# Altium schematic sheet RF_circuit.SchDoc
size A1; SheetNumber: 4; SheetTotal: 6
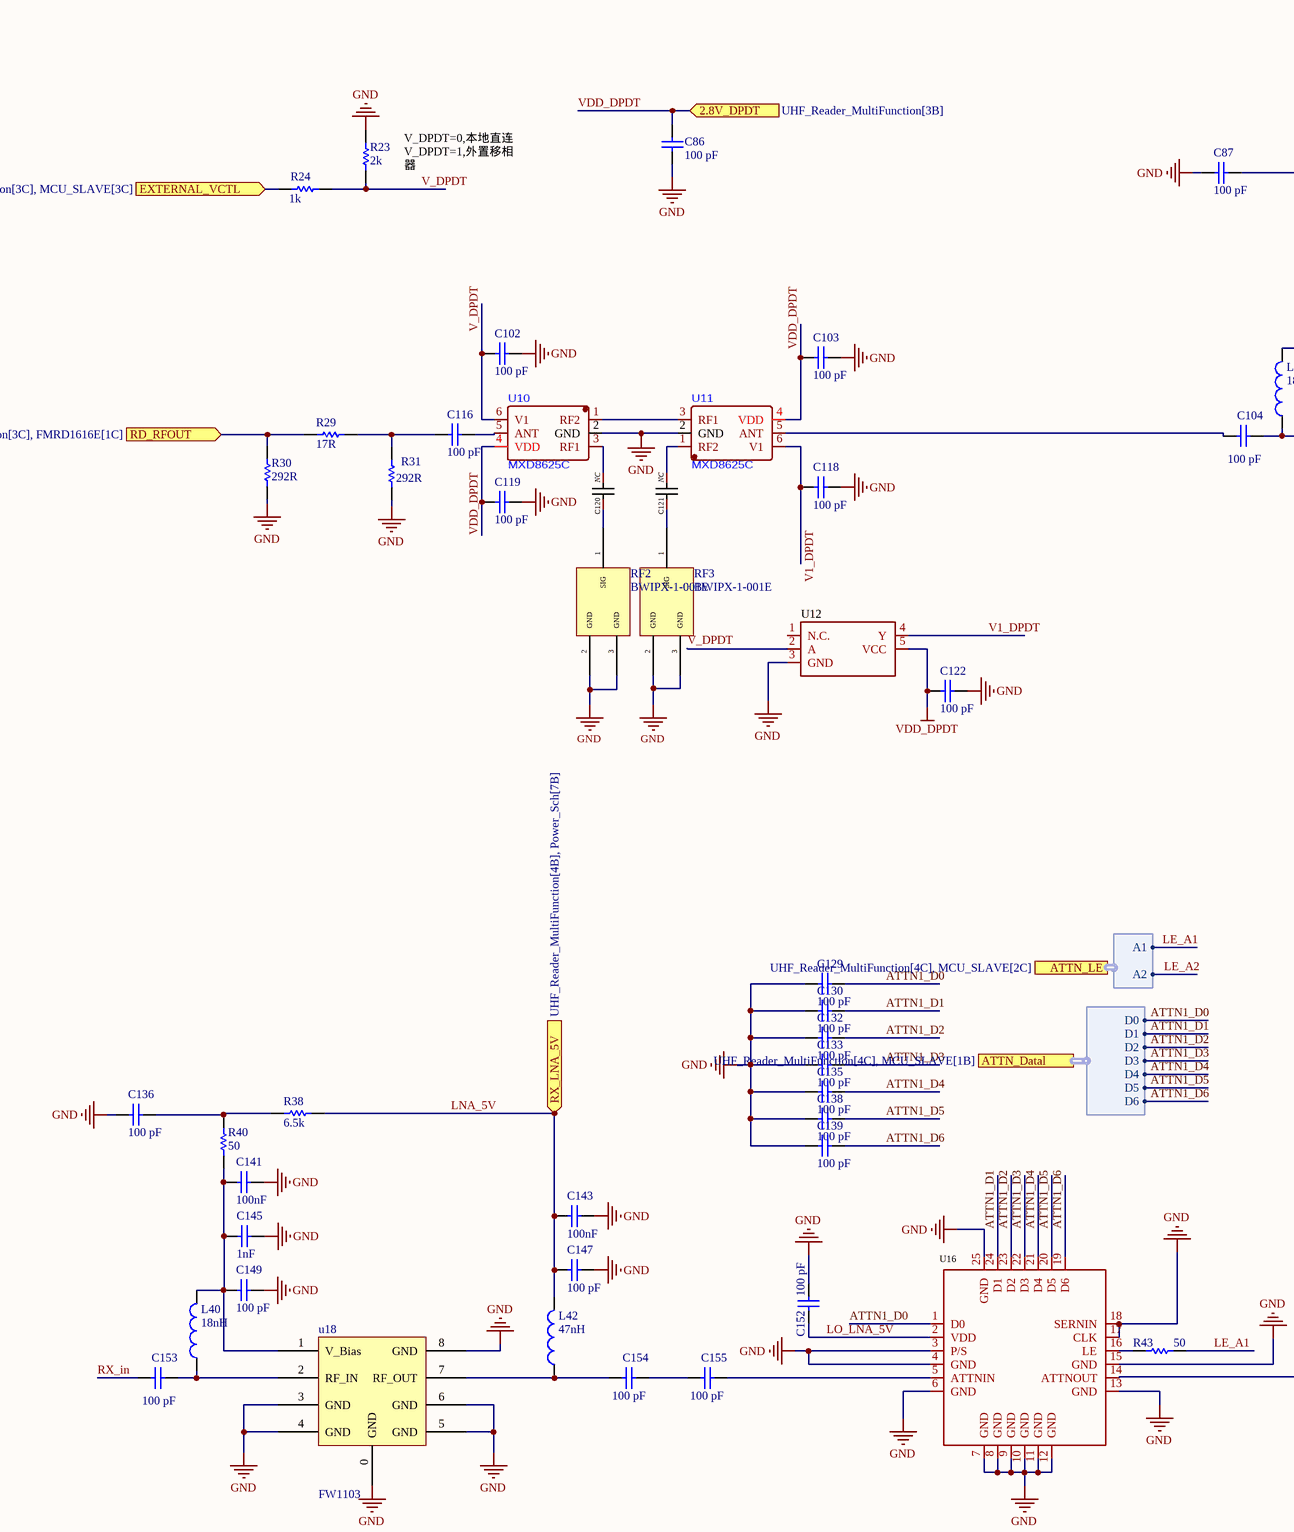
[diagram p0: RF_circuit.SchDoc, top left]
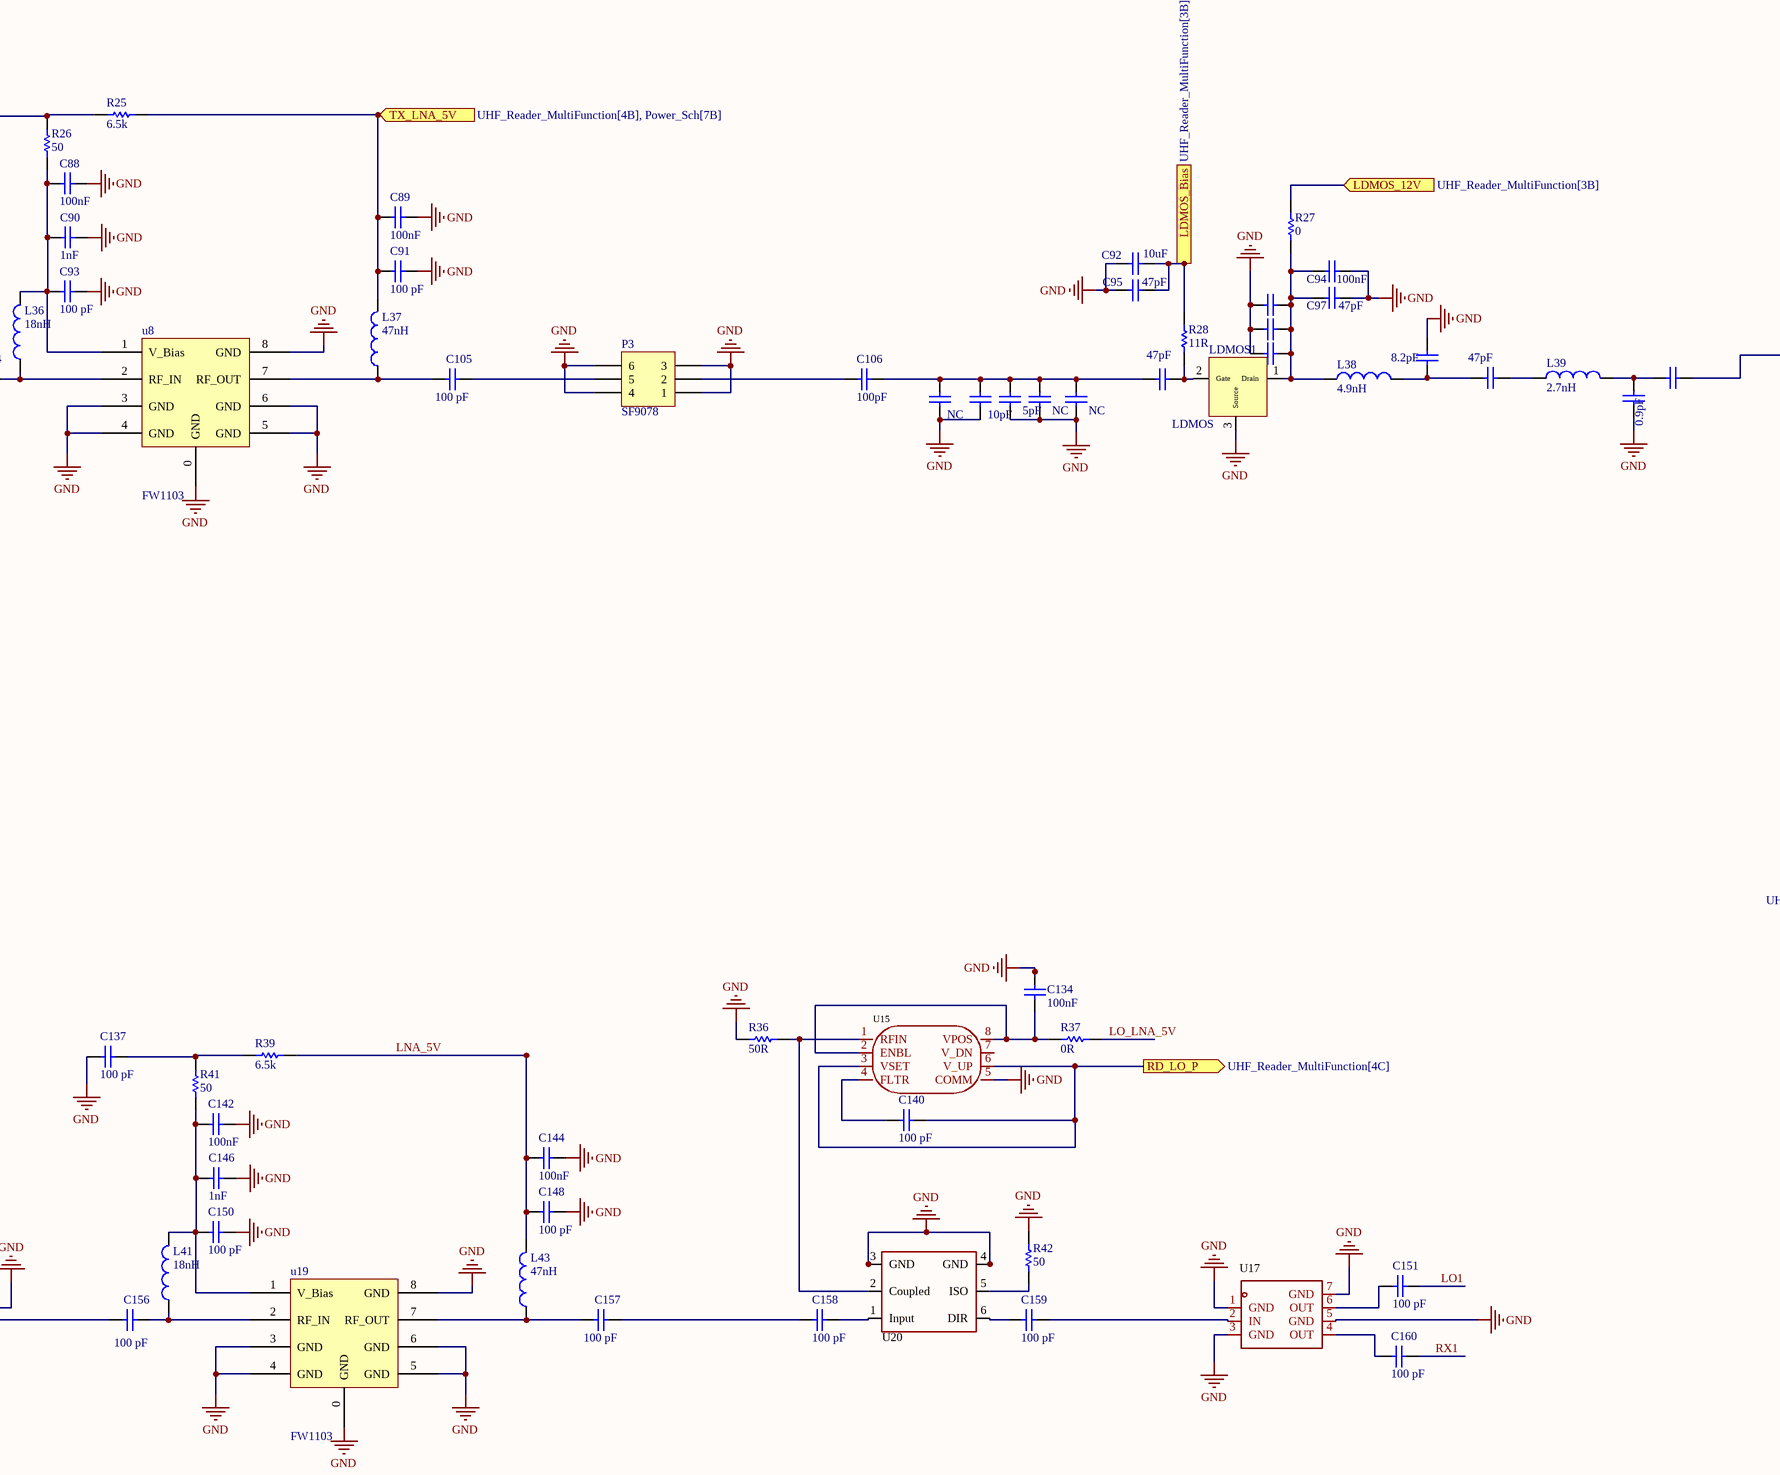
[diagram p1: RF_circuit.SchDoc, top middle]
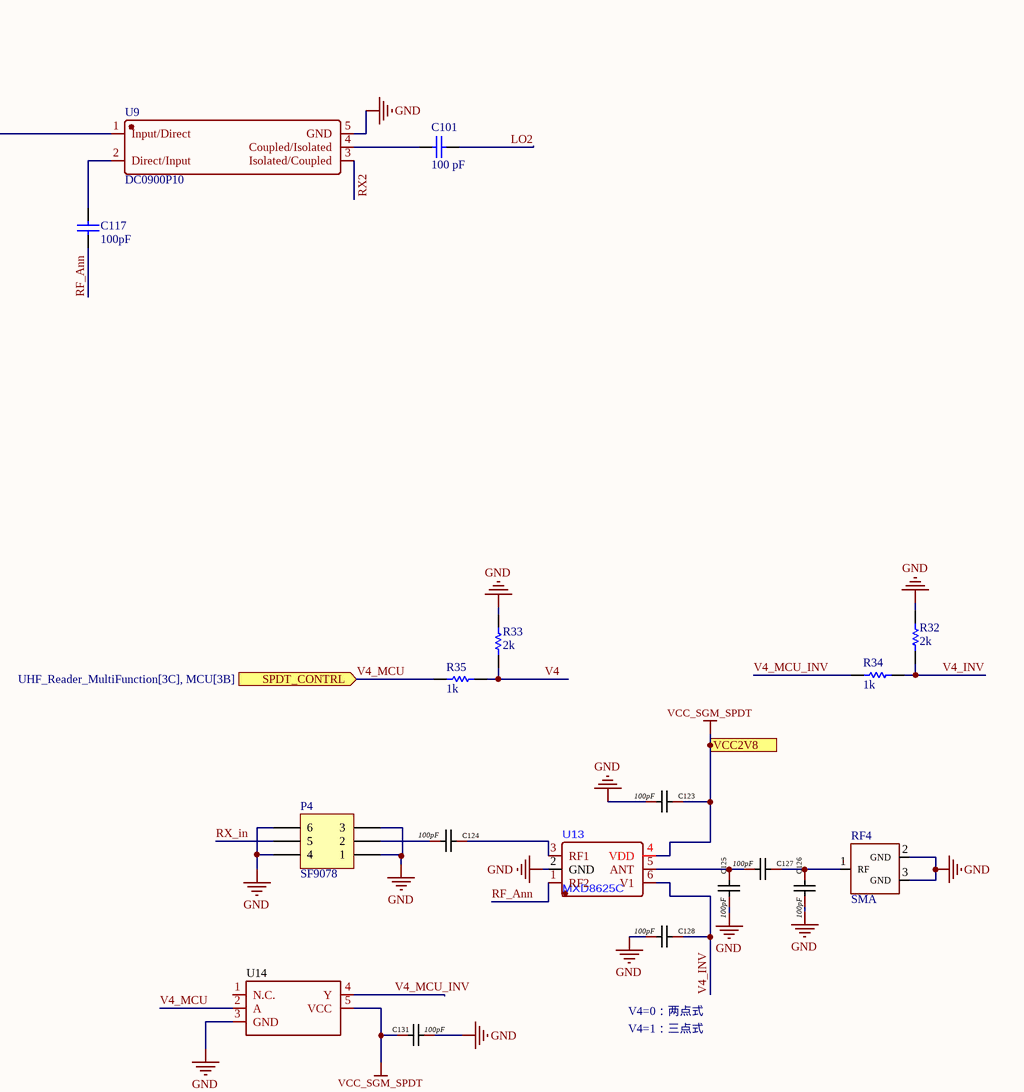
[diagram p2: RF_circuit.SchDoc, top right]
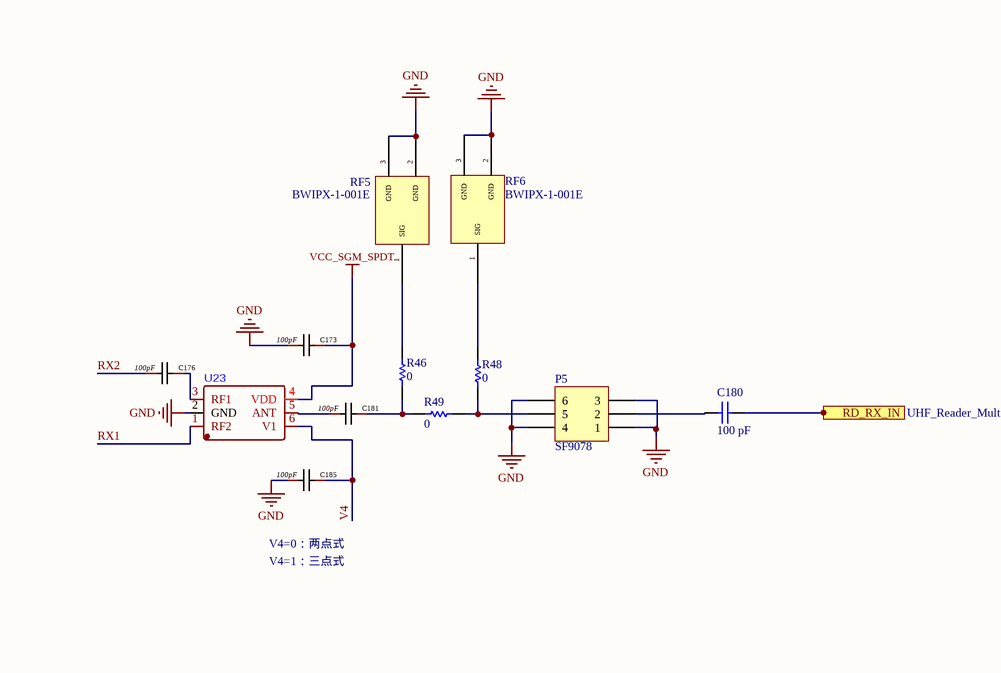
[diagram p3: RF_circuit.SchDoc, bottom left]
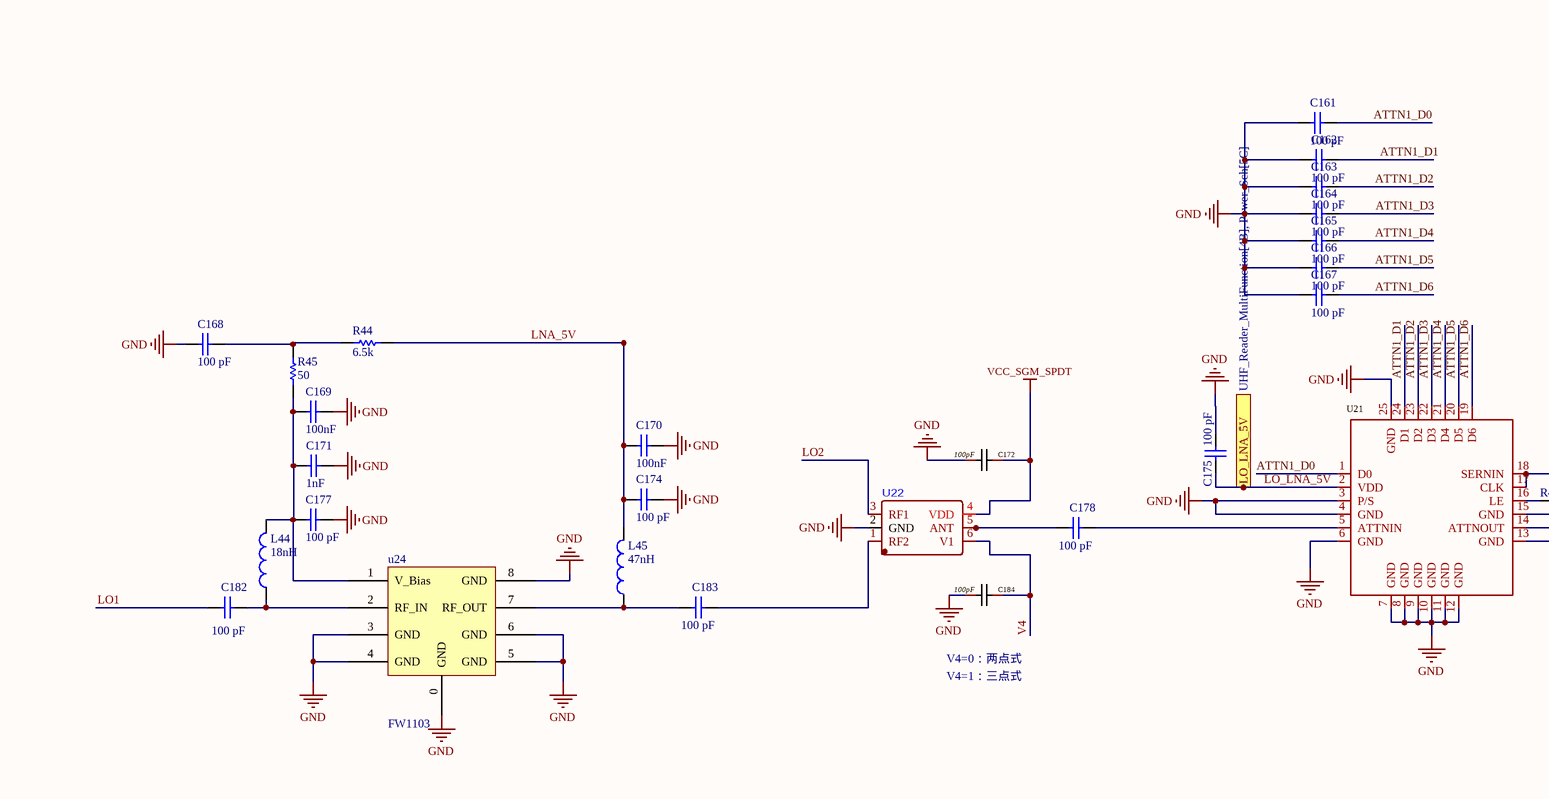
[diagram p4: RF_circuit.SchDoc, bottom middle]
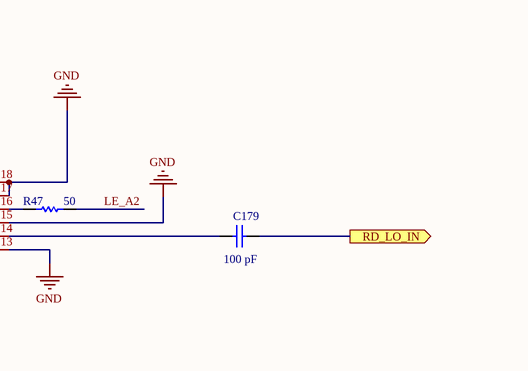
[diagram p5: RF_circuit.SchDoc, bottom right]

## Parts
C86  100 pF  [0402_Z]
C87  100 pF  [0402_Z]
C88  100nF  [0402_Z]
C89  100nF  [0402_Z]
C90  1nF  [0402_Z]
C91  100 pF  [0402_Z]
C92  10uF  [0805_Z]
C93  100 pF  [0402_Z]
C94  100nF  [1210_Z]
C95  47pF  [0603_Z]
C96  NC  [0603_Z]  (value not drawn)
C97  47pF  [0805_Z]
C98  NC  [0603_Z]  (value not drawn)
C99  NC  [0603_Z]  (value not drawn)
C100  8.2pF  [0402_Z]
C101  100 pF  [0402_Z]
C102  100 pF  [0402_Z]
C103  100 pF  [0402_Z]
C104  100 pF  [0402_Z]
C105  100 pF  [0402_Z]
C106  100pF  [0603_Z]
C107  47pF  [0402_Z]
C108  47pF  [0603_Z]
C109  100pF  [0603_Z]  (value not drawn)
C110  NC  [0402_Z]
C111  10pF  [0402_Z]
C112  0.9pF  [0402_Z]
C113  5pF  [0402_Z]
C114  NC  [0402_Z]
C115  NC  [0402_Z]
C116  100 pF  [0402_Z]
C117  100pF  [0402_Z]
C118  100 pF  [0402_Z]
C119  100 pF  [0402_Z]
C120  NC  [0402_Z]  (no BOM)
C121  NC  [0402_Z]  (no BOM)
C122  100 pF  [0402_Z]
C123  100pF  [0402_Z]
C124  100pF  [0402_Z]
C125  100pF  [0402_Z]
C126  100pF  [0402_Z]
C127  100pF  [0402_Z]
C128  100pF  [0402_Z]
C129  100 pF  [0402_Z]
C130  100 pF  [0402_Z]
C131  100pF  [0402_Z]
C132  100 pF  [0402_Z]
C133  100 pF  [0402_Z]
C134  100nF  [0402_Z]
C135  100 pF  [0402_Z]
C136  100 pF  [0402_Z]
C137  100 pF  [0402_Z]
C138  100 pF  [0402_Z]
C139  100 pF  [0402_Z]
C140  100 pF  [0402_Z]
C141  100nF  [0402_Z]
C142  100nF  [0402_Z]
C143  100nF  [0402_Z]
C144  100nF  [0402_Z]
C145  1nF  [0402_Z]
C146  1nF  [0402_Z]
C147  100 pF  [0402_Z]
C148  100 pF  [0402_Z]
C149  100 pF  [0402_Z]
C150  100 pF  [0402_Z]
C151  100 pF  [0402_Z]
C152  100 pF  [0402_Z]
C153  100 pF  [0402_Z]
C154  100 pF  [0402_Z]
C155  100 pF  [0402_Z]
C156  100 pF  [0402_Z]
C157  100 pF  [0402_Z]
C158  100 pF  [0402_Z]
C159  100 pF  [0402_Z]
C160  100 pF  [0402_Z]
C161  100 pF  [0402_Z]
C162  100 pF  [0402_Z]
C163  100 pF  [0402_Z]
C164  100 pF  [0402_Z]
C165  100 pF  [0402_Z]
C166  100 pF  [0402_Z]
C167  100 pF  [0402_Z]
C168  100 pF  [0402_Z]
C169  100nF  [0402_Z]
C170  100nF  [0402_Z]
C171  1nF  [0402_Z]
C172  100pF  [0402_Z]
C173  100pF  [0402_Z]
C174  100 pF  [0402_Z]
C175  100 pF  [0402_Z]
C176  100pF  [0402_Z]
C177  100 pF  [0402_Z]
C178  100 pF  [0402_Z]
C179  100 pF  [0402_Z]
C180  100 pF  [0402_Z]
C181  100pF  [0402_Z]
C182  100 pF  [0402_Z]
C183  100 pF  [0402_Z]
C184  100pF  [0402_Z]
C185  100pF  [0402_Z]
L36  18nH  [0402_Z]
L37  47nH  [0402_Z]
L38  4.9nH  [0603_Z]
L39  2.7nH  [0603_Z]
L40  18nH  [0402_Z]
L41  18nH  [0402_Z]
L42  47nH  [0402_Z]
L43  47nH  [0402_Z]
L44  18nH  [0402_Z]
L45  47nH  [0402_Z]
LDMOS1  LDMOS  [LDMOS]
P3  SF9078  [SF8009]
P4  SF9078  [SF8009]
P5  SF9078  [SF8009]
R23  2k  [0402_Z]
R24  1k  [0402_Z]
R25  6.5k  [0402_Z]
R26  50  [0402_Z]
R27  0  [0805]
R28  11R  [0603_Z]
R29  17R  [0402_Z]
R30  292R  [0402_Z]
R31  292R  [0402_Z]
R32  2k  [0402_Z]
R33  2k  [0402_Z]
R34  1k  [0402_Z]
R35  1k  [0402_Z]
R36  50R  [0402_Z]
R37  0R  [0402_Z]
R38  6.5k  [0402_Z]
R39  6.5k  [0402_Z]
R40  50  [0402_Z]
R41  50  [0402_Z]
R42  50  [0402_Z]
R43  50  [0402_Z]
R44  6.5k  [0402_Z]
R45  50  [0402_Z]
R46  0  [0402_Z]
R47  50  [0402_Z]
R48  0  [0402_Z]
R49  0  [0402_Z]
RF2  BWIPX-1-001E  [IPEX-SMD_BWIPX-1-001E]
RF3  BWIPX-1-001E  [IPEX-SMD_BWIPX-1-001E]
RF4  SMA  [SMAmini - duplicate]
RF5  BWIPX-1-001E  [IPEX-SMD_BWIPX-1-001E]
RF6  BWIPX-1-001E  [IPEX-SMD_BWIPX-1-001E]
u8  FW1103  [FW1103W]
U9  DC0900P10  [DC0900P10]
U10  MXD8625C  [MXD8625C]
U11  MXD8625C  [MXD8625C]
U12  AiP74LVC1G14GC.TR  [SOT-353 L2.1-W1.3-P0.65]  (value not drawn)
U13  MXD8625C  [BGA-6_L1.1-W0.7-R3-C2-P0.40-BR]
U14  AiP74LVC1G14GC.TR  [SOT-353_L2.1-W1.3-P0.65]  (value not drawn)
U15  MS2351  [MS2351]  (value not drawn)
U16  HGC2005LP4  [HGC2005LP4]  (value not drawn)
U17  PD0900U03-070  [PD0900U03-070]  (value not drawn)
u18  FW1103  [FW1103W]
u19  FW1103  [FW1103W]
U20  DC09T10  [DC09T10]  (value not drawn)
U21  HGC2005LP4  [HGC2005LP4]  (value not drawn)
U22  (no value)  [BGA-6_L1.1-W0.7-R3-C2-P0.40-BR]
U23  (no value)  [BGA-6_L1.1-W0.7-R3-C2-P0.40-BR]
u24  FW1103  [FW1103W]

## Ports
2.8V_DPDT (in, see UHF_Reader_MultiFunction[3B]), ATTN_Datal (harness ATTN1, see UHF_Reader_MultiFunction[4C], MCU_SLAVE[1B]), ATTN_LE (harness ATTN_LE, see UHF_Reader_MultiFunction[4C], MCU_SLAVE[2C]), EXTERNAL_VCTL (in, see UHF_Reader_MultiFunction[3C], MCU_SLAVE[3C]), LDMOS_12V (in, see UHF_Reader_MultiFunction[3B]), LDMOS_Bias (in, see UHF_Reader_MultiFunction[3B]), LO_LNA_5V (in, see UHF_Reader_MultiFunction[4B], Power_Sch[5C]), RD_LO_IN (out, see UHF_Reader_MultiFunction[3B], FMRD1616E[2A]), RD_LO_P (out, see UHF_Reader_MultiFunction[4C]), RD_RFOUT (in, see UHF_Reader_MultiFunction[3C], FMRD1616E[1C]), RD_RX_IN (out, see UHF_Reader_MultiFunction[3B], FMRD1616E[2A]), RX_LNA_5V (in, see UHF_Reader_MultiFunction[4B], Power_Sch[7B]), SPDT_CONTRL (in, see UHF_Reader_MultiFunction[3C], MCU[3B]), TX_LNA_5V (in, see UHF_Reader_MultiFunction[4B], Power_Sch[7B]), VCC2V8 (in, see UHF_Reader_MultiFunction[3B], Power_Sch[3D])

## Harnesses
ATTN1: D0, D1, D2, D3, D4, D5, D6
ATTN_LE: A1, A2

## Nets
GND: C86.1 C87.2 C88.1 C89.1 C90.1 C91.1 C92.1 C93.1 C94.2 C95.1 C96.1 C97.2 C98.1 C99.1 C100.1 C102.1 C103.1 C110.2 C111.2 C112.2 C113.1 C114.1 C115.1 C118.1 C119.1 C122.1 C123.2 C125.2 C126.2 C128.2 C129.2 C130.1 C131.2 C132.1 C133.1 C134.1 C135.2 C136.2 C137.2 C138.2 C139.2 C141.1 C142.1 C143.1 C144.1 C145.1 C146.1 C147.1 C148.1 C149.1 C150.1 C152.2 C161.2 C162.1 C163.1 C164.1 C165.2 C166.2 C167.2 C168.2 C169.1 C170.1 C171.1 C172.2 C173.2 C174.1 C175.2 C177.1 C184.2 C185.2 LDMOS1.3(Source) P3.1 P3.3 P3.4 P3.6 P4.1 P4.3 P4.4 P4.6 P5.1 P5.3 P5.4 P5.6 R23.1 R30.1 R31.1 R32.1 R33.1 R36.2 R42.1 RF2.2(GND) RF2.3(GND) RF3.2(GND) RF3.3(GND) RF4.2(GND) RF4.3(GND) RF5.2(GND) RF5.3(GND) RF6.2(GND) RF6.3(GND) u8.0(GND) u8.3(GND) u8.4(GND) u8.5(GND) u8.6(GND) u8.8(GND) U9.5(GND) U10.2(GND) U11.2(GND) U12.3(GND) U13.2(GND) U14.3(GND) U15.5(COMM) U16.3(P/S) U16.4(GND) U16.6(GND) U16.7(GND) U16.8(GND) U16.9(GND) U16.10(GND) U16.11(GND) U16.12(GND) U16.13(GND) U16.15(GND) U16.17(CLK) U16.18(SERNIN) U16.25(GND) U17.1(GND) U17.3(GND) U17.5(GND) U17.7(GND) u18.0(GND) u18.3(GND) u18.4(GND) u18.5(GND) u18.6(GND) u18.8(GND) u19.0(GND) u19.3(GND) u19.4(GND) u19.5(GND) u19.6(GND) u19.8(GND) U20.3(GND) U20.4(GND) U21.3(P/S) U21.4(GND) U21.6(GND) U21.7(GND) U21.8(GND) U21.9(GND) U21.10(GND) U21.11(GND) U21.12(GND) U21.13(GND) U21.15(GND) U21.17(CLK) U21.18(SERNIN) U21.25(GND) U22.2(GND) U23.2(GND) u24.0(GND) u24.3(GND) u24.4(GND) u24.5(GND) u24.6(GND) u24.8(GND)
VCC_SGM_SPDT: C123.1 C131.1 C172.1 C173.1 U13.4(VDD) U14.5(VCC) U22.4(VDD) U23.4(VDD) ; port VCC2V8
VDD_DPDT: C86.2 C103.2 C119.2 C122.2 U10.4(VDD) U11.4(VDD) U12.5(VCC) ; port 2.8V_DPDT
ATTN1_D0: C129.1 C161.1 U16.1(D0) U21.1(D0) ; port ATTN_Datal.D0
ATTN1_D1: C130.2 C162.2 U16.24(D1) U21.24(D1) ; port ATTN_Datal.D1
ATTN1_D2: C132.2 C163.2 U16.23(D2) U21.23(D2) ; port ATTN_Datal.D2
ATTN1_D3: C133.2 C164.2 U16.22(D3) U21.22(D3) ; port ATTN_Datal.D3
ATTN1_D4: C135.1 C165.1 U16.21(D4) U21.21(D4) ; port ATTN_Datal.D4
ATTN1_D5: C138.1 C166.1 U16.20(D5) U21.20(D5) ; port ATTN_Datal.D5
ATTN1_D6: C139.1 C167.1 U16.19(D6) U21.19(D6) ; port ATTN_Datal.D6
EXTERNAL_VCTL: R24.1 ; port EXTERNAL_VCTL
LDMOS_12V: R27.1 ; port LDMOS_12V
LDMOS_Bias: C92.2 C95.2 R28.2 ; port LDMOS_Bias
LE_A1: R43.2 ; port ATTN_LE.A1
LE_A2: R47.2 ; port ATTN_LE.A2
LNA_5V: C143.2 C144.2 C147.2 C148.2 C170.2 C174.2 L42.2 L43.2 L45.2 R38.2 R39.2 R44.2 ; port RX_LNA_5V
LO1: C151.1 C182.2
LO2: C101.2 U22.3(RF1)
LO_LNA_5V: C152.1 C175.1 R37.2 U16.2(VDD) U21.2(VDD) ; port LO_LNA_5V
RD_LO_IN: C179.1 ; port RD_LO_IN
RD_LO_P: C140.1 U15.3(VSET) U15.6(V_UP) ; port RD_LO_P
RD_RFOUT: R29.1 R30.2 ; port RD_RFOUT
RD_RX_IN: C180.1 ; port RD_RX_IN
RF_Ann: C117.1 U13.1(RF2)
RX1: C160.1 U23.1(RF2)
RX2: C176.2 U9.3(Isolated/Coupled)
RX_in: C153.2 P4.5
TX_LNA_5V: C89.2 C91.2 L37.2 R25.2 ; port TX_LNA_5V
V1_DPDT: C118.2 U11.6(V1) U12.4(Y)
V4: C184.1 C185.1 R33.2 R35.2 U22.6(V1) U23.6(V1)
V4_INV: C128.1 R32.2 R34.2 U13.6(V1)
V4_MCU: R35.1 U14.2(A) ; port SPDT_CONTRL
V4_MCU_INV: R34.1 U14.4(Y)
V_DPDT: C102.2 R23.2 R24.2 U10.6(V1) U12.2(A)
NetC87_1: C87.1 R25.1 R26.1
NetC88_2: C88.2 C90.2 C93.2 L36.2 R26.2 u8.1(V_Bias)
NetC94_1: C94.1 C96.2 C97.1 C98.2 C99.2 L38.1 LDMOS1.1(Drain) R27.2
NetC100_2: C100.2 C108.1 L38.2
NetC101_1: C101.1 U9.4(Coupled/Isolated)
NetC104_1: C104.1 L36.1 u8.2(RF_IN)
NetC104_2: C104.2 U11.5(ANT)
NetC105_1: C105.1 P3.5
NetC105_2: C105.2 L37.1 u8.7(RF_OUT)
NetC106_1: C106.1 P3.2
NetC106_2: C106.2 C107.1 C110.1 C111.1 C113.2 C114.2 C115.2
NetC107_2: C107.2 LDMOS1.2(Gate) R28.1
NetC108_2: C108.2 L39.1
NetC109_1: C109.1 C112.1 L39.2
NetC109_2: C109.2 U9.1(Input/Direct)
NetC116_1: C116.1 U10.5(ANT)
NetC116_2: C116.2 R29.2 R31.2
NetC117_2: C117.2 U9.2(Direct/Input)
NetC120_1: C120.1 RF2.1(SIG)
NetC120_2: C120.2 U10.3(RF1)
NetC121_1: C121.1 RF3.1(SIG)
NetC121_2: C121.2 U11.1(RF2)
NetC124_1: C124.1 U13.3(RF1)
NetC124_2: C124.2 P4.2
NetC125_1: C125.1 C127.2 U13.5(ANT)
NetC126_1: C126.1 C127.1 RF4.1(RF)
NetC134_2: C134.2 R37.1 U15.2(ENBL) U15.8(VPOS)
NetC136_1: C136.1 R38.1 R40.1
NetC137_1: C137.1 R39.1 R41.1
NetC140_2: C140.2 U15.4(FLTR)
NetC141_2: C141.2 C145.2 C149.2 L40.2 R40.2 u18.1(V_Bias)
NetC142_2: C142.2 C146.2 C150.2 L41.2 R41.2 u19.1(V_Bias)
NetC151_2: C151.2 U17.6(OUT)
NetC153_1: C153.1 L40.1 u18.2(RF_IN)
NetC154_1: C154.1 C155.2
NetC154_2: C154.2 L42.1 u18.7(RF_OUT)
NetC155_1: C155.1 U16.5(ATTNIN)
NetC156_1: C156.1 L41.1 u19.2(RF_IN)
NetC156_2: C156.2 U16.14(ATTNOUT)
NetC157_1: C157.1 C158.2
NetC157_2: C157.2 L43.1 u19.7(RF_OUT)
NetC158_1: C158.1 U20.1(Input)
NetC159_1: C159.1 U17.2(IN)
NetC159_2: C159.2 U20.6(DIR)
NetC160_2: C160.2 U17.4(OUT)
NetC168_1: C168.1 R44.1 R45.1
NetC169_2: C169.2 C171.2 C177.2 L44.2 R45.2 u24.1(V_Bias)
NetC176_1: C176.1 U23.3(RF1)
NetC178_1: C178.1 U21.5(ATTNIN)
NetC178_2: C178.2 U22.5(ANT)
NetC179_2: C179.2 U21.14(ATTNOUT)
NetC180_2: C180.2 P5.2
NetC181_1: C181.1 R46.1 R49.2
NetC181_2: C181.2 U23.5(ANT)
NetC182_1: C182.1 L44.1 u24.2(RF_IN)
NetC183_1: C183.1 U22.1(RF2)
NetC183_2: C183.2 L45.1 u24.7(RF_OUT)
NetP5_5: P5.5 R48.1 R49.1
NetR36_1: R36.1 U15.1(RFIN) U20.2(Coupled)
NetR42_2: R42.2 U20.5(ISO)
NetR43_1: R43.1 U16.16(LE)
NetR46_2: R46.2 RF5.1(SIG)
NetR47_1: R47.1 U21.16(LE)
NetR48_2: R48.2 RF6.1(SIG)
NetU10_1: U10.1(RF2) U11.3(RF1)

Not connected (* = marked no-connect by the designer): U12 1(N.C.); U14 1(N.C.); U15 7(V_DN)

## Notes on the sheet
- (near R23) V_DPDT=0,本地直连V_DPDT=1,外置移相器
- V4=0：两点式
- V4=1：三点式

## Library data of the parts
C86-C105 C107 C108 C110-C116 C118 C119 C122 C129 C130 C132-C171 C174 C175 C177-C180 C182 C183 = Cap: Capacitor; Value: 100pF; Published: 8-Jun-2000; LatestRevisionDate: 17-Jul-2002; LatestRevisionNote: Re-released for DXP Platform.; PackageReference: RAD-0.3; Publisher: Altium Limited; PackageDescription: Radial Cap, Thru-Hole; 2 Leads; 0.3 in Pin Spacing
C106 C109 C117 = Cap: Capacitor; Published: 8-Jun-2000; LatestRevisionDate: 17-Jul-2002; LatestRevisionNote: Re-released for DXP Platform.; PackageReference: RAD-0.3; Publisher: Altium Limited; PackageDescription: Radial Cap, Thru-Hole; 2 Leads; 0.3 in Pin Spacing; Value: 100pF
C120 C121 = Cap_NC
C123-C128 C131 C172 C173 C176 C181 C184 C185 = Cap
L36-L45 = Inductor: Code_IEC: 1005; Value: 10mH; Published: 8-Jun-2000; LatestRevisionDate: 29-May-2009; LatestRevisionNote: IPC-7351 Footprint Added.; PackageReference: 0402-A; Publisher: Altium Limited; PackageDescription: Chip Inductor; Code_JEITA: 0402
P3-P5 = Header 3X2A: Header, 3-Pin, Dual row; LatestRevisionDate: 17-Jul-2002; LatestRevisionNote: Re-released for DXP Platform.; Publisher: Altium Limited
R23 R24 R32-R35 = Resistor: Thick Film Resistor
  R23 R32 R33: Value: 2k
  R24 R34 R35: Value: 1k
R25-R31 R36-R49 = Res1: Resistor; Value: 1K; Published: 8-Jun-2000; LatestRevisionDate: 17-Jul-2002; LatestRevisionNote: Re-released for DXP Platform.; PackageReference: AXIAL-0.3; Publisher: Altium Limited; PackageDescription: Axial Device, Thru-Hole; 2 Leads; 0.3 in Pin Spacing
U9 = DC0900A10
U12 U14 = 反相器: Manufacturer_Name: Wuxi I-CORE Electronics Co.; Datasheet Link: https://datasheet.lcsc.com/lcsc/2208161803_Wuxi-I-core-Elec-AiP74LVC1G14GC-TR_C5138995.pdf; Height: 1.1mm; Manufacturer_Part_Number: AiP74LVC1G14GC
U15 = MS2351: 功率检测器; Manufacturer: 杭州瑞盟; Add into BOM: yes; Name: MS2351; Symbol: MS2351; Device: MS2351; LCSC Part Name: MS2351; Supplier Part: C1509084; Manufacturer Part: MS2351; Supplier Footprint: MSOP-8; JLCPCB Part Class: Extended Part; Datasheet: https://atta.szlcsc.com/upload/public/pdf/source/20201221/C1509084_D980DDA325D6CD8A9ADBC0470C8A29D7.pdf; Supplier: LCSC; Convert to PCB: yes; Amplifier Type: -; Number of Circuits: -; -3db Bandwidth（G=1）: -; Current - Input Bias（Ib）: -; Voltage - Input Offset（Vos）: -; Gain Bandwidth Product（GBP）: -; Slew Rate（SR）: -; Output Type: -; Supply Voltage（Single）: -; Iq per channel (Typ): -; Operating Temperature: -
U16 U21 = HGC2005LP4: 数控衰减器
U17 = 功分器_研通: 工作频率 800-1000 MHz
U22 U23 = MXD8625C